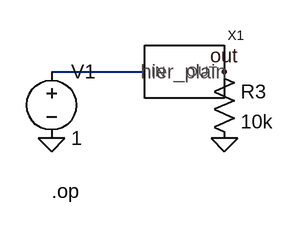
[diagram p0: schematic hier_plain_top.asc]
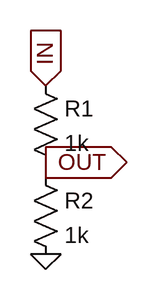
[diagram p1: sub-circuit hier_plain.asc]
hier_plain_top.asc, the LTspice schematic file:
Version 4
SHEET 1 880 680
WIRE 0 16 112 16
FLAG 0 96 0
FLAG 208 16 out
FLAG 208 96 0
SYMBOL voltage 0 0 R0
SYMATTR InstName V1
SYMATTR Value 1
SYMBOL hier_plain 160 16 R0
SYMATTR InstName X1
SYMBOL res 192 0 R0
SYMATTR InstName R3
SYMATTR Value 10k
TEXT 0 160 Left 2 !.op

hier_plain.asc, the sub-circuit schematic file:
Version 4
SHEET 1 880 680
WIRE 0 96 0 112
FLAG 0 16 IN
IOPIN 0 16 In
FLAG 0 96 OUT
IOPIN 0 96 Out
FLAG 0 192 0
SYMBOL res -16 0 R0
SYMATTR InstName R1
SYMATTR Value 1k
SYMBOL res -16 96 R0
SYMATTR InstName R2
SYMATTR Value 1k

The netlist it stands for:
* hier_plain_top.asc
V1 N001 0 1
XX1 N001 out hier_plain
R3 out 0 10k

* block symbol definitions
.subckt hier_plain IN OUT
R1 IN OUT 1k
R2 OUT 0 1k
.ends hier_plain

.op
.backanno
.end